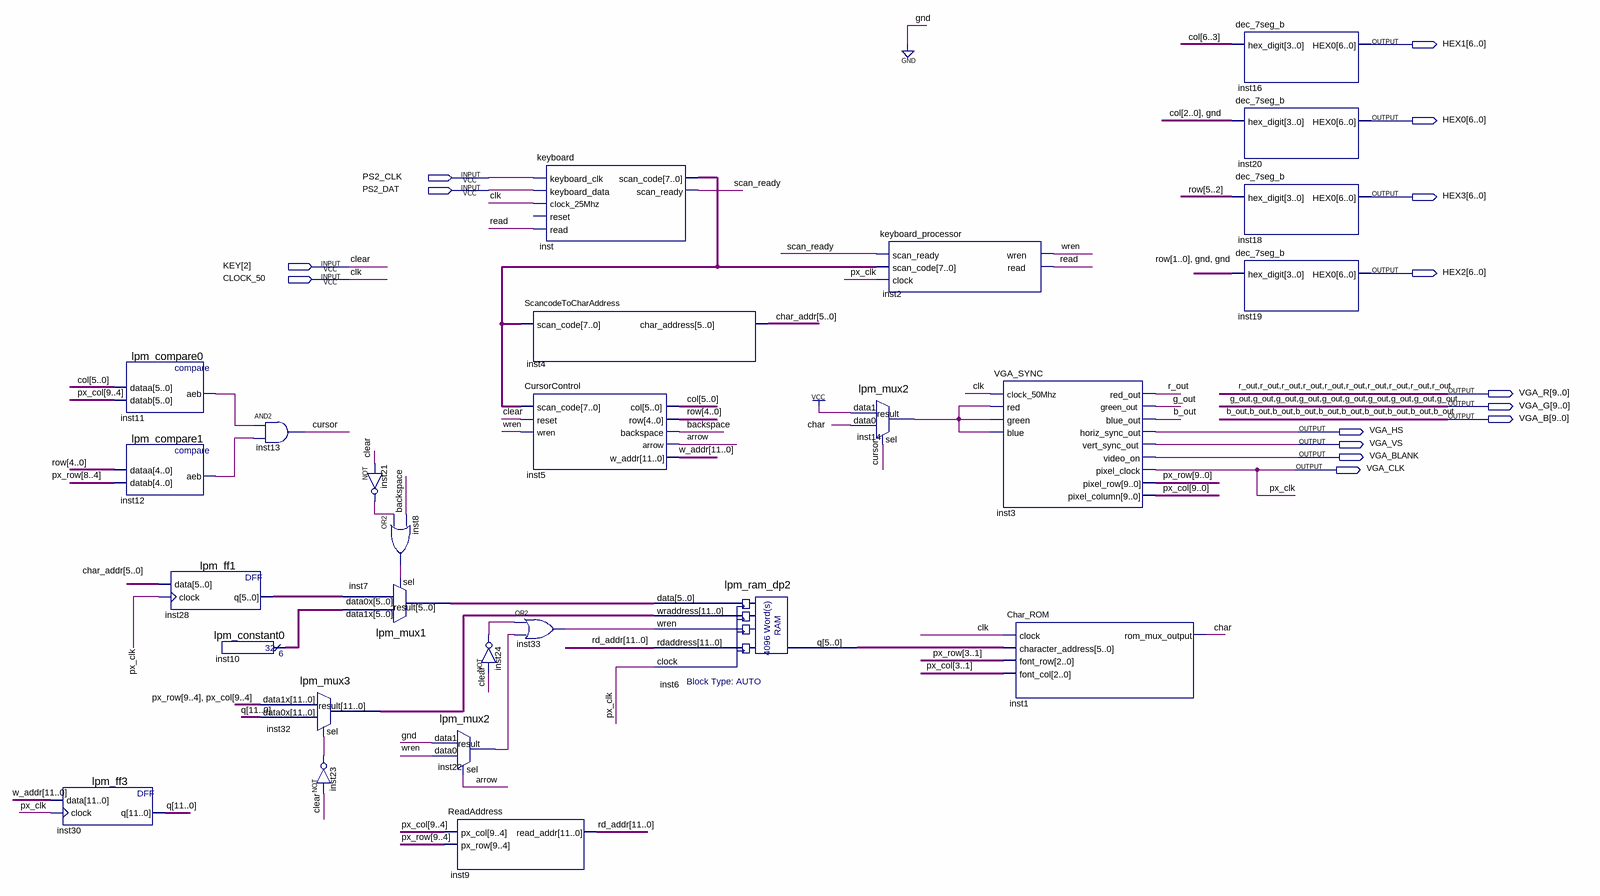
[diagram p0: schematic sheet]
// Quartus schematic editor_texto.bdf as structural Verilog: 27 symbols, 15 pins
module editor_texto (
  input  PS2_CLK,
  input  PS2_DAT,
  input  [2:2] KEY,
  input  CLOCK_50,
  output [6:0] HEX1,
  output [6:0] HEX0,
  output [6:0] HEX3,
  output [6:0] HEX2,
  output [9:0] VGA_R,
  output [9:0] VGA_G,
  output [9:0] VGA_B,
  output VGA_HS,
  output VGA_VS,
  output VGA_BLANK,
  output VGA_CLK
);

  wire arrow, backspace, char, cursor, inst8_out, inst11_aeb, inst12_aeb, inst14_result, inst21_out,
       inst22_result, inst23_out, inst24_out, inst33_out, read, scan_ready, wren;
  wire [5:0] char_addr, inst6_q, inst7_result, inst10_result, inst28_q, row;
  wire [6:0] col;
  wire [7:0] inst_scan_code;
  wire [9:0] px_col, px_row;
  wire [11:0] inst32_result, q, rd_addr, w_addr;

  lpm_ff3 inst30 (.data(w_addr), .clock(VGA_CLK), .q(q));
  lpm_compare0 inst11 (.dataa(col[5:0]), .datab(px_col[9:4]), .aeb(inst11_aeb));
  lpm_compare1 inst12 (.dataa(row[4:0]), .datab(px_row[8:4]), .aeb(inst12_aeb));
  lpm_ff1 inst28 (.data(char_addr), .clock(VGA_CLK), .q(inst28_q));
  lpm_constant0 inst10 (.result(inst10_result));
  and inst13 (cursor, inst11_aeb, inst12_aeb);
  lpm_mux3 inst32 (.data1x({px_row[9:4], px_col[9:4]}), .data0x(q), .sel(inst23_out), .result(inst32_result));
  not inst23 (inst23_out, KEY[2]);
  not inst21 (inst21_out, KEY[2]);
  lpm_mux1 inst7 (.data1x(inst10_result), .data0x(inst28_q), .sel(inst8_out), .result(inst7_result));
  or inst8 (inst8_out, inst21_out, backspace);
  lpm_mux2 inst22 (.data1(1'b0), .data0(wren), .sel(arrow), .result(inst22_result));
  ReadAddress inst9 (.px_col(px_col[9:4]), .px_row(px_row[9:4]), .read_addr(rd_addr));
  or inst33 (inst33_out, inst24_out, inst22_result);
  not inst24 (inst24_out, KEY[2]);
  keyboard inst (
    .keyboard_clk(PS2_CLK), .keyboard_data(PS2_DAT), .clock_25Mhz(CLOCK_50), .read(read),
    .scan_code(inst_scan_code), .scan_ready(scan_ready));  // open: reset
  ScancodeToCharAddress inst4 (.scan_code(inst_scan_code), .char_address(char_addr));
  CursorControl inst5 (
    .scan_code(inst_scan_code), .reset(KEY[2]), .wren(wren), .col(col[5:0]), .row(row[4:0]),
    .backspace(backspace), .arrow(arrow), .w_addr(w_addr));
  lpm_ram_dp2 inst6 (
    .data(inst7_result), .wraddress(inst32_result), .wren(inst33_out), .rdaddress(rd_addr), .clock(VGA_CLK),
    .q(inst6_q));
  lpm_mux2 inst14 (.data1(1'b1), .data0(char), .sel(cursor), .result(inst14_result));
  keyboard_processor inst2 (
    .scan_ready(scan_ready), .scan_code(inst_scan_code), .clock(VGA_CLK), .wren(wren), .read(read));
  VGA_SYNC inst3 (
    .clock_50Mhz(CLOCK_50), .red(inst14_result), .green(inst14_result), .blue(inst14_result),
    .red_out(VGA_R[9]), .green_out(VGA_G[9]), .blue_out(VGA_B[9]), .horiz_sync_out(VGA_HS),
    .vert_sync_out(VGA_VS), .video_on(VGA_BLANK), .pixel_clock(VGA_CLK), .pixel_row(px_row),
    .pixel_column(px_col));
  Char_ROM inst1 (
    .clock(CLOCK_50), .character_address(inst6_q), .font_row(px_row[3:1]), .font_col(px_col[3:1]),
    .rom_mux_output(char));
  dec_7seg_b inst16 (.hex_digit(col[6:3]), .HEX0(HEX1));
  dec_7seg_b inst20 (.hex_digit({col[2:0], 1'b0}), .HEX0(HEX0));
  dec_7seg_b inst18 (.hex_digit(row[5:2]), .HEX0(HEX3));
  dec_7seg_b inst19 (.hex_digit({row[1:0], 2'b00}), .HEX0(HEX2));

  assign VGA_B[8:0] = {9{VGA_B[9]}};
  assign VGA_G[8:0] = {9{VGA_G[9]}};
  assign VGA_R[8:0] = {9{VGA_R[9]}};

  // Other names for the same wires on the sheet: b_out = VGA_B[9]; clear = KEY[2]; clk = CLOCK_50; g_out = VGA_G[9];
  //   px_clk = VGA_CLK; r_out = VGA_R[9]
endmodule
